# Altium project Fitness-Tracker-v1.0.PrjPcb
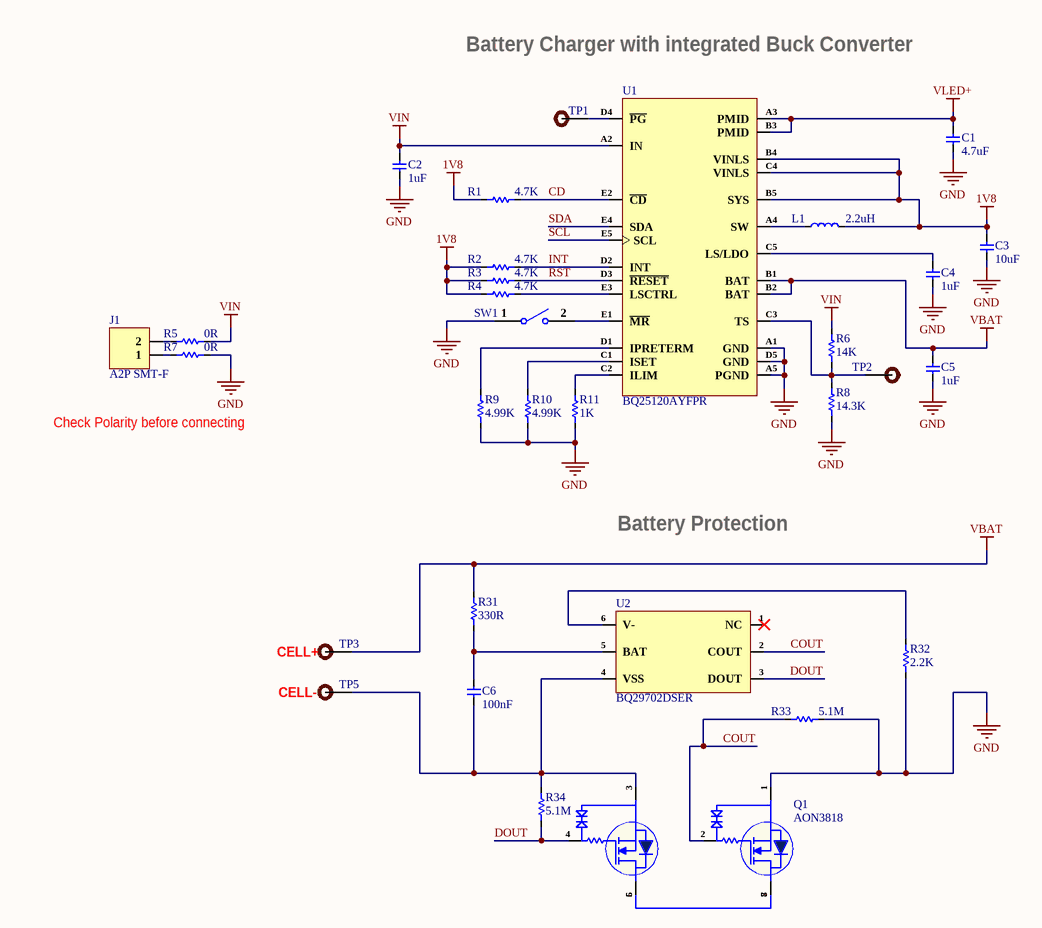
[diagram p0: Power-Sheet.SchDoc]
3 sheets, 65 parts. Net scope: global (net labels, ports and power ports of the same name join across sheets).
Board file: TrackerPCB-v1.0.PcbDoc
Sheets:
  Power-Sheet.SchDoc
  Controller-Sheet.SchDoc
  Sensors-Sheet.SchDoc

## Sheet Power-Sheet.SchDoc
size A4; SheetNumber: 1; SheetTotal: 3

### Parts
C1  4.7uF  [Cap-0402]
C2  1uF  [CAP-0201]
C3  10uF  [Cap-0402]
C4  1uF  [CAP-0201]
C5  1uF  [CAP-0201]
C6  100nF  [CAP-0201]
J1  A2P SMT-F  [A2P SMT-F]
L1  2.2uH  [IND-0805]
Q1  AON3818  [DFN-8(3x3)]
R1  4.7K  [Res-0201]
R2  4.7K  [Res-0201]
R3  4.7K  [Res-0201]
R4  4.7K  [Res-0201]
R5  0R  [Res-0201]
R6  14K  [Res-0201]
R7  0R  [Res-0201]
R8  14.3K  [Res-0201]
R9  4.99K  [Res-0402]
R10  4.99K  [Res-0402]
R11  1K  [Res-0201]
R31  330R  [Res-0201]
R32  2.2K  [Res-0201]
R33  5.1M  [Res-0201]
R34  5.1M  [Res-0201]
SW1  B3U-1000P  [B3U-1000P]  (value not drawn)
TP1  TEST POINT 0.5mm Dia  [Test-point - 0.5mm]  (value not drawn)  (no BOM)
TP2  TEST POINT 0.5mm Dia  [Test-point - 0.5mm]  (value not drawn)  (no BOM)
TP3  3x4mm Test Pad SMD  [3x4mm Test Pad SMD]  (value not drawn)
TP5  3x4mm Test Pad SMD  [3x4mm Test Pad SMD]  (value not drawn)
U1  BQ25120AYFPR  [25-DSBGA]
U2  BQ29702DSER  [WSON-6(1.5x1.5)]

### Nets
1V8: C3.2 L1.2 R1.1 R2.1 R3.1 R4.1 U1.B4(VINLS) U1.B5(SYS) U1.C4(VINLS)
GND: C1.1 C2.1 C3.1 C4.1 C5.1 Q1.1(S2) R7.2 R8.1 R9.1 R10.1 R11.1 R32.1 R33.1 SW1.1 U1.A1(GND) U1.A5(PGND) U1.D5(GND)
VBAT: C5.2 R31.2 TP3.1 U1.B1(BAT) U1.B2(BAT)
VIN: C2.2 R5.2 R6.2 U1.A2(IN)
VLED+: C1.2 U1.A3(PMID) U1.B3(PMID)
CD: R1.2 U1.E2(~{CD})
COUT: Q1.2(G2) R33.2 U2.2(COUT)
DOUT: Q1.4(G1) R34.1 U2.3(DOUT)
INT: R2.2 U1.D2(INT)
RST: R3.2 U1.D3(~{RESET})
SCL: U1.E5(SCL)
SDA: U1.E4(SDA)
NetC4_2: C4.2 U1.C5(LS/LDO)
NetC6_1: C6.1 R31.1 U2.5(BAT)
NetC6_2: C6.2 Q1.3(S1) R34.2 TP5.1 U2.4(VSS)
NetJ1_1: J1.1 R7.1
NetJ1_2: J1.2 R5.1
NetL1_1: L1.1 U1.A4(SW)
NetQ1_5: Q1.5(D2) Q1.6(D2)
NetQ1_7: Q1.7(D1) Q1.8(D1)
NetR4_2: R4.2 U1.E3(LSCTRL)
NetR6_1: R6.1 R8.2 TP2.1 U1.C3(TS)
NetR9_2: R9.2 U1.D1(IPRETERM)
NetR10_2: R10.2 U1.C1(ISET)
NetR11_2: R11.2 U1.C2(ILIM)
NetR32_2: R32.2 U2.6(V-)
NetSW1_2: SW1.2 U1.E1(~{MR})
NetTP1_1: TP1.1 U1.D4(~{PG})

Not connected (* = marked no-connect by the designer): U2 1(NC)*

### Notes on the sheet
- Battery Charger with integrated Buck Converter
- Check Polarity before connecting
- Battery Protection
- (near TP3) CELL+
- (near TP5) CELL-
- File:
- Title:
- Date:
- Page
- Num:
- Total:
- Drawn By: Huzaifa Ali

### Library data of the parts
C1 = CC0402KRX5R6BB475: CAP CER 4.7UF 10V X5R 0402; Manufacturer: Yageo; Tolerance: 10%; Supplier 1: Farnell; Manufacturer Part Number: CC0402KRX5R6BB475; RoHS: Yes; Category: Ceramic Capacitors; Stock 1: 20000; Pricing 1: 10000=0.02310, 50000=0.02100 (GBP); Mount: Surface Mount; Case/Package: 0402; Case Code (Imperial): 0402; Case Code (Metric): 1005; Min Operating Temperature: -55°C; Max Operating Temperature: 85°C; Packaging: Cut Tape; Capacitance: 4.7uF; Voltage Rating: 10V; RoHS Compliant: Yes; ComponentLink1URL: http://www.yageo.com/documents/recent/UPY-GPHC_X5R_4V-to-50V_25.pdf?src-supplier=Digi-Key; ComponentLink1Description: http://www.yageo.com/documents/recent/UPY-GPHC_X5R_4V-to-50V_25.pdf?src-supplier=Digi-Key; Supplier Part Number 1: 3871698; LCSC Part Number: C326586
C2 C4 C5 = CC0201MRX5R6BB105: CAP CER 1UF 10V X5R 0201; Manufacturer: Yageo; Item Type: Capacitor; Supplier: Digi-Key; Supplier Part Number: 311-3474-1-ND; Manufacturer Part Number: CC0201MRX5R6BB105; RoHS: Yes; Category: Ceramic Capacitors; Stock: 772400; Pricing: 1=0.19, 10=0.135, 50=0.0764, 100=0.0633, 500=0.04436, 1000=0.03672, 2500=0.03418, 5000=0.03127 (USD); ComponentLink1URL: https://datasheet.octopart.com/CC0201MRX5R6BB105-Yageo-datasheet-158238148.pdf?src-supplier=Farnell; ComponentLink1Description: https://datasheet.octopart.com/CC0201MRX5R6BB105-Yageo-datasheet-158238148.pdf?src-supplier=Farnell; ComponentLink2URL: http://www.yageo.com/documents/recent/UPY-GPHC_X5R_4V-to-50V_25.pdf?src-supplier=Digi-Key; ComponentLink2Description: http://www.yageo.com/documents/recent/UPY-GPHC_X5R_4V-to-50V_25.pdf?src-supplier=Digi-Key; ComponentLink3URL: https://datasheet.octopart.com/CC0201MRX5R6BB105-Yageo-datasheet-137700082.pdf?src-supplier=Future+Electronics; ComponentLink3Description: https://datasheet.octopart.com/CC0201MRX5R6BB105-Yageo-datasheet-137700082.pdf?src-supplier=Future+Electronics; LCSC Part Number: C605210
C3 = CC0402MRX5R6BB106: CAP CER 10UF 10V X5R 0402; Manufacturer: Yageo; Tolerance: 20%; Item Type: Capacitor; Supplier 1: Future Electronics; Manufacturer Part Number: CC0402MRX5R6BB106; RoHS: Yes; Category: Ceramic Capacitors; Stock 1: 80000; Pricing 1: 10000=0.02650, 20000=0.02590, 30000=0.02550, 40000=0.02530, 50000=0.02450 (USD); Mount: Surface Mount; Case/Package: 0402; Case Code (Imperial): 0402; Case Code (Metric): 1005; Min Operating Temperature: -55°C; Max Operating Temperature: 85°C; Packaging: Tape and Reel; Capacitance: 10uF; Voltage Rating: 10V; RoHS Compliant: Yes; ComponentLink1URL: http://www.yageo.com/documents/recent/UPY-GPHC_X5R_4V-to-50V_25.pdf?src-supplier=Digi-Key; ComponentLink1Description: http://www.yageo.com/documents/recent/UPY-GPHC_X5R_4V-to-50V_25.pdf?src-supplier=Digi-Key; Supplier Part Number 1: 6097631; LCSC Part Number: C962143
C6 = CC0201KRX5R6BB104: CAP CER 0.1UF 10V X5R 0201; Manufacturer: Yageo; Tolerance: 10%; Supplier 1: Mouser; Manufacturer Part Number: CC0201KRX5R6BB104; RoHS: Yes; Category: Ceramic Capacitors; Stock 1: 824403; Pricing 1: 1=0.10000, 10=0.02400, 50=0.02400, 100=0.01900, 1000=0.01100, 10000=0.00900 (USD); Mount: Surface Mount; Case/Package: 0201; Case Code (Imperial): 0201; Case Code (Metric): 0603; Weight: 6E-06oz; Min Operating Temperature: -55°C; Max Operating Temperature: 85°C; Capacitance: 100nF; Dielectric: X5R; Voltage Rating (DC): 10V; Packaging: Tape and Reel; Termination: SMD/SMT; Resistor Type: Ceramic; Voltage Rating: 10V; Series: CC; Construction: Flat; Length: 0.6mm; Width: 0.012inch; Height: 0.3mm; Thickness: 0.013inch; Depth: 0.3mm; Radiation Hardening: No; Lead Free: Lead Free; Halogen Free: Halogen Free; RoHS Compliant: Yes; ComponentLink1URL: https://datasheet.ciiva.com/11587/upy-gphc-x5r-4v-to-50v-12-11587190.pdf?src-supplier=Avnet; ComponentLink1Description: https://datasheet.ciiva.com/11587/upy-gphc-x5r-4v-to-50v-12-11587190.pdf?src-supplier=Avnet; Supplier Part Number 1: 603-CC201KRX5R6BB104; LCSC Part Number: C190183
J1 = A2P SMT-F: Magnetic Pogo Pin Connector 2 Positions Pitch 2.5/2.6 MM Spring Loaded Female Strip; Manufacturer Part Number: Pogo Pin Connector 2 Pin Female (2mm Height); ComponentLink1Description: Aliexpress; ComponentLink1URL: https://vi.aliexpress.com/item/1005003511237426.html#nav-description
L1 = LQM21PN2R2MGHL: FIXED IND 2.2UH 1.3A 156MOHM SMD; Manufacturer: Murata; Item Type: Fixed Inductors; Core Material: Ferrite; Saturation Current: 450mA; Shielding: Shielded; DC Resistance (DCR): 156mR; Self Resonant Frequency: 40MHz; Test Frequency: 1MHz; Tolerance: 20%; RMS Current (Irms): 1.7A; Supplier: Mouser; LCSC Part Number: C341781; Manufacturer Part Number: LQM21PN2R2MGHL; RoHS: Yes; Stock: 122655; Pricing: 1=0.3, 10=0.246, 50=0.246, 100=0.203, 1000=0.167, 10000=0.129 (USD); Mounting Technology: Surface Mount; Case/Package: 0805; Case Code (Metric): 2012; Case Code (Imperial): 0805; Min Operating Temperature: -40°C; Max Operating Temperature: 85°C; Packaging: Cut Tape; Value: 2.2uH; Current Rating: 1.3A; Series: LQM21PN_GH; ESR: 156mR; Length: 0.079inch; Width: 0.049inch; Height - Seated (Max): 0.039inch; RoHS Compliant: Yes; ComponentLink1URL: http://search.murata.co.jp/Ceramy/image/img/P02/JELF243B-0040.pdf?src-supplier=Digikey; ComponentLink1Description: http://search.murata.co.jp/Ceramy/image/img/P02/JELF243B-0040.pdf?src-supplier=Digikey; ComponentLink2URL: http://www.murata.com/~/media/webrenewal/support/library/catalog/products/inductor/chip/o05e.ashx?src-supplier=Digikey; ComponentLink2Description: http://www.murata.com/~/media/webrenewal/support/library/catalog/products/inductor/chip/o05e.ashx?src-supplier=Digikey
Q1 = AON3818: 24V 8A 21mΩ@2.5V 2.7W 1.2V@250uA 2 N-Channel DFN-8(3x3) MOSFETs ROHS; Manufacturer: AOS; Item Type: Mosfet; Manufacturer Part Number: AON3818; Package: DFN-8(3x3); LCSC Part Number: C357850
R1-R4 = RC0201FR-074K7L: RES 4.7K OHM 1% 1/20W 0201; Manufacturer: Yageo; Item Type: Resistor; Supplier: Future Electronics; Supplier Part Number: 7537285; Manufacturer Part Number: RC0201FR-074K7L; RoHS: Yes; Category: Chip SMD Resistors; Stock: 1610000; Pricing: 10000=0.0014, 50000=0.0013, 250000=0.0013, 750000=0.0012, 2000000=0.0011 (USD); ComponentLink1URL: https://datasheet.ciiva.com/2493/pyu-r-int-thick-7-2493811.pdf?src-supplier=Digi-Key; ComponentLink1Description: https://datasheet.ciiva.com/2493/pyu-r-int-thick-7-2493811.pdf?src-supplier=Digi-Key; ComponentLink2URL: https://datasheet.ciiva.com/2493/pyu-r-int-thick-7-2493812.pdf?src-supplier=Digi-Key; ComponentLink2Description: https://datasheet.ciiva.com/2493/pyu-r-int-thick-7-2493812.pdf?src-supplier=Digi-Key; ComponentLink3URL: https://datasheet.ciiva.com/2493/pyu-r-int-thick-7-2493813.pdf?src-supplier=Digi-Key; ComponentLink3Description: https://datasheet.ciiva.com/2493/pyu-r-int-thick-7-2493813.pdf?src-supplier=Digi-Key; ComponentLink4URL: https://datasheet.ciiva.com/8892/pyu-rc0201-51-rohs-l-8-8892942.pdf?src-supplier=Avnet; ComponentLink4Description: https://datasheet.ciiva.com/8892/pyu-rc0201-51-rohs-l-8-8892942.pdf?src-supplier=Avnet; ComponentLink5URL: https://datasheet.ciiva.com/7672/1563626-7672233.pdf?src-supplier=Element14; ComponentLink5Description: https://datasheet.ciiva.com/7672/1563626-7672233.pdf?src-supplier=Element14; LCSC Part Number: C138135
R5 R7 = RC0201JR-070RL: RES SMD 0 OHM JUMPER 1/20W 0201; Manufacturer: Yageo; Power Rating: 50mW; Tolerance: 5%; Voltage Rating: 25V; Supplier 1: Digi-Key; Manufacturer Part Number: RC0201JR-070RL; RoHS: Yes; Category: Chip SMD Resistors; Stock 1: 11079; Pricing 1: 1=0.10000, 10=0.03600, 25=0.02640, 50=0.02000, 100=0.01480, 250=0.01128, 500=0.00904, 1000=0.00665, 5000=0.00477 (USD); Case/Package: 0201; Contact Plating: Tin,Matte; Case Code (Metric): 0603; Case Code (Imperial): 0201; Weight: 6E-06oz; Size Code: 0201; Min Operating Temperature: -55°C; Max Operating Temperature: 125°C; Resistor Type: Thick Film; Resistance: 0R; Packaging: Tape and Reel; Package Quantity: 10000; Number of Terminations: 2; Termination: SMD/SMT; Max Power Dissipation: 50mW; Voltage Rating (DC): 25V; Features: Moisture Resistant; Series: RC; Construction: Rectangular; Resistance Tolerance: 5%; Length: 0.6mm; Width: 0.012inch; Height: 0.01inch; Depth: 0.3mm; Radiation Hardening: No; RoHS Compliant: Yes; REACH SVHC: Unknown; Military Standard: Not; Lead Free: Lead Free; ComponentLink1URL: https://datasheet.ciiva.com/7672/1563626-7672247.pdf?src-supplier=Element14; ComponentLink1Description: https://datasheet.ciiva.com/7672/1563626-7672247.pdf?src-supplier=Element14; ComponentLink2URL: https://datasheet.ciiva.com/7660/1421516-7660808.pdf?src-supplier=Element14; ComponentLink2Description: https://datasheet.ciiva.com/7660/1421516-7660808.pdf?src-supplier=Element14; ComponentLink3URL: https://datasheet.ciiva.com/7672/1563626-7672248.pdf?src-supplier=Element14; ComponentLink3Description: https://datasheet.ciiva.com/7672/1563626-7672248.pdf?src-supplier=Element14; ComponentLink4URL: https://datasheet.ciiva.com/16855/pyu-rc0201-51-rohs-l-8-16855994.pdf?src-supplier=Avnet+Europe; ComponentLink4Description: https://datasheet.ciiva.com/16855/pyu-rc0201-51-rohs-l-8-16855994.pdf?src-supplier=Avnet+Europe; ComponentLink5URL: https://datasheet.ciiva.com/28419/pyu-rc0201-51-rohs-l-8-28419660.pdf?src-supplier=Avnet+Europe; ComponentLink5Description: https://datasheet.ciiva.com/28419/pyu-rc0201-51-rohs-l-8-28419660.pdf?src-supplier=Avnet+Europe; ComponentLink6URL: https://datasheet.ciiva.com/46391/1421516-46391340.pdf?src-supplier=Element14; ComponentLink6Description: https://datasheet.ciiva.com/46391/1421516-46391340.pdf?src-supplier=Element14; ComponentLink7URL: https://datasheet.ciiva.com/8896/pyu-rc0201-51-rohs-l-8-8896143.pdf?src-supplier=Avnet; ComponentLink7Description: https://datasheet.ciiva.com/8896/pyu-rc0201-51-rohs-l-8-8896143.pdf?src-supplier=Avnet; Supplier Part Number 1: 311-0.0NCT-ND; LCSC Part Number: C106228
R6 = 0201WMF1402TEE: 50mW Thick Film Resistor 25V ±1% ±200ppm/℃ 14kΩ 0201 Chip Resistor - Surface Mount ROHS; Manufacturer: UNI-ROYAL; Manufacturer Part Number: 0201WMF1402TEE; Package: 0201; LCSC Part Number: C474280; Item Type: Resistor; ComponentLink1Description: LCSC; ComponentLink1URL: https://www.lcsc.com/product-detail/C474280.html
R8 = RC0201FR-0714K3L: RES 14.3K OHM 1% 1/20W 0201; Manufacturer: Yageo; Item Type: Resistors; Voltage Rating: 25V; Supplier: Avnet; LCSC Part Number: C273298; Manufacturer Part Number: RC0201FR-0714K3L; RoHS: Yes; Stock: 7360; Pricing: 1=0.104, 25=0.018, 100=0.009, 250=0.008, 500=0.007 (USD); Lead Free: 5697LeadFree; ComponentLink1URL: https://www.yageo.com/upload/media/product/productsearch/datasheet/rchip/PYu-RC_Group_51_RoHS_L_11.pdf?src-supplier=Digikey; ComponentLink1Description: https://www.yageo.com/upload/media/product/productsearch/datasheet/rchip/PYu-RC_Group_51_RoHS_L_11.pdf?src-supplier=Digikey; ComponentLink2URL: http://www.yageo.com/documents/recent/PYu-RC_Group_51_RoHS_L_10.pdf?src-supplier=Digikey; ComponentLink2Description: http://www.yageo.com/documents/recent/PYu-RC_Group_51_RoHS_L_10.pdf?src-supplier=Digikey; ComponentLink3URL: http://www.yageo.com/documents/recent/PYu-RC_Group_51_RoHS_L_9.pdf?src-supplier=Digikey; ComponentLink3Description: http://www.yageo.com/documents/recent/PYu-RC_Group_51_RoHS_L_9.pdf?src-supplier=Digikey; ComponentLink4URL: https://datasheet.octopart.com/RC0201FR-0714K3L-Yageo-datasheet-164759695.pdf?src-supplier=Future+Electronics; ComponentLink4Description: https://datasheet.octopart.com/RC0201FR-0714K3L-Yageo-datasheet-164759695.pdf?src-supplier=Future+Electronics
R9 R10 = RC0402FR-074K99L: RES 4.99K OHM 1% 1/16W 0402; Manufacturer: Yageo; Item Type: Resistors; Value: 4.99kR; Power Rating: 62.5mW; Voltage Rating: 50V; Temperature Coefficient: 100ppm/°C; Max Power Dissipation: 63mW; Supplier: Mouser; LCSC Part Number: C137965; Manufacturer Part Number: RC0402FR-074K99L; RoHS: Yes; Stock: 181979; Pricing: 1=0.1, 10=0.007, 50=0.007, 100=0.004, 1000=0.004, 10000=0.002 (USD); Case/Package: 0402; Case Code (Imperial): 0402; Case Code (Metric): 1005; Min Operating Temperature: -55°C; Max Operating Temperature: 155°C; Tolerance: 1%; Package Quantity: 1; Packaging: Tape and Reel; Resistor Type: Thick Film; Termination: SMD/SMT; Number of Terminations: 2; Features: Moisture Resistant; Series: RC; Construction: Rectangular; Resistance Tolerance: 1%; Voltage Rating (DC): 50V; Length: 1mm; Width: 0.02inch; Height: 0.016inch; Depth: 0.5mm; Reach SVHC Compliant: No; Military Standard: Not; RoHS Compliant: Yes; Lead Free: 5697LeadFree; ComponentLink1URL: https://datasheet.ciiva.com/7983/1018594-7983547.pdf?src-supplier=Element14; ComponentLink1Description: https://datasheet.ciiva.com/7983/1018594-7983547.pdf?src-supplier=Element14; ComponentLink2URL: https://datasheet.ciiva.com/2553/pyu-r-int-thick-7-2553228.pdf?src-supplier=Digikey; ComponentLink2Description: https://datasheet.ciiva.com/2553/pyu-r-int-thick-7-2553228.pdf?src-supplier=Digikey; ComponentLink3URL: https://datasheet.ciiva.com/2553/pyu-r-int-thick-7-2553229.pdf?src-supplier=Digikey; ComponentLink3Description: https://datasheet.ciiva.com/2553/pyu-r-int-thick-7-2553229.pdf?src-supplier=Digikey; ComponentLink4URL: https://datasheet.ciiva.com/2553/pyu-r-int-thick-7-2553227.pdf?src-supplier=Digikey; ComponentLink4Description: https://datasheet.ciiva.com/2553/pyu-r-int-thick-7-2553227.pdf?src-supplier=Digikey; ComponentLink5URL: https://datasheet.ciiva.com/17040/pyu-rc0402-51-rohs-l-6-r-17040490.pdf?src-supplier=Future+Electronics; ComponentLink5Description: https://datasheet.ciiva.com/17040/pyu-rc0402-51-rohs-l-6-r-17040490.pdf?src-supplier=Future+Electronics; ComponentLink6URL: https://datasheet.ciiva.com/15159/getdatasheetpartid-33192-15159419.pdf?src-supplier=Verical; ComponentLink6Description: https://datasheet.ciiva.com/15159/getdatasheetpartid-33192-15159419.pdf?src-supplier=Verical
R11 = RC0201FR-071KP: RES 1K OHM 1% 1/20W 0201; Manufacturer: Yageo; Supplier 1: Digi-Key; Manufacturer Part Number: RC0201FR-071KP; RoHS: Yes; Stock 1: 4800; Pricing 1: 1=0.11000, 10=0.10200, 100=0.03940, 1000=0.01734, 2500=0.01497, 5000=0.01340 (USD); RoHS Compliant: Yes; Supplier Part Number 1: 13-RC0201FR-071KPCT-ND; LCSC Part Number: C3953443
R31 = RC0201FR-07330RL: 50mW Thick Film Resistor 25V ±1% ±200ppm/℃ 330Ω 0201 Chip Resistor - Surface Mount ROHS; Manufacturer: YAGEO; Manufacturer Part Number: RC0201FR-07330RL; Package: 0201; LCSC Part Number: C274872; Item Type: Resistor
R32 = RC0201FR-072K2L: RES 2.2K OHM 1% 1/20W 0201; Manufacturer: Yageo; Resistance: 2.2kR; Power Rating: 50mW; Voltage Rating: 25V; Temperature Coefficient: 200ppm/°C; Item Type: Resistor; Supplier 1: Arrow Electronics; Manufacturer Part Number: RC0201FR-072K2L; RoHS: Yes; Category: Chip SMD Resistors; Stock 1: 90000; Pricing 1: 10000=0.00510, 30000=0.00350, 50000=0.00330, 100000=0.00220 (USD); Case/Package: 0201; Case Code (Imperial): 0201; Case Code (Metric): 0603; Size Code: 0201; Min Operating Temperature: -55°C; Max Operating Temperature: 125°C; Tolerance: 1%; Packaging: Tape and Reel; Resistor Type: Thick Film; Number of Terminations: 2; Termination: SMD/SMT; Max Power Dissipation: 50mW; Features: Moisture Resistant; Series: RC; Resistance Tolerance: 1%; Construction: Rectangular; Length: 0.024inch; Width: 0.3mm; Height: 0.01inch; Depth: 0.3mm; Military Standard: Not; Lead Free: Lead Free; RoHS Compliant: Yes; ComponentLink1URL: https://datasheet.ciiva.com/7672/1563626-7672218.pdf?src-supplier=Element14; ComponentLink1Description: https://datasheet.ciiva.com/7672/1563626-7672218.pdf?src-supplier=Element14; Supplier Part Number 1: RC0201FR-072K2L; LCSC Part Number: C142018
R33 R34 = RC0201FR-075M1L: 50mW Thick Film Resistor 25V ±1% ±200ppm/℃ 5.1MΩ 0201 Chip Resistor - Surface Mount ROHS; Manufacturer: YAGEO; Manufacturer Part Number: RC0201FR-075M1L; Package: 0201; LCSC Part Number: C474428; Item Type: Resistor
SW1 = B3U-1000P: SWITCH TACTILE SPST-NO 0.05A 12V; Manufacturer: Omron; Mechanical Life: 200000Cycles; Operating Force: 1.5N; Throw Configuration: SPST; Current Rating: 50mA; Contact Resistance: 100mR; Illumination Type: Non-Illuminated,Illuminated; Switch Travel: 0.15mm; Switch Function: Off-Mom; Actuator Type: Standard; Actuator Length: 0.4mm; Ratings: Dust Proof,IP40; ComponentLink1URL: http://www.farnell.com/datasheets/60838.pdf?src-supplier=Farnell; ComponentLink1Description: http://www.farnell.com/datasheets/60838.pdf?src-supplier=Farnell; ComponentLink2URL: http://www.farnell.com/datasheets/60838.pdf?src-supplier=Element14; ComponentLink2Description: http://www.farnell.com/datasheets/60838.pdf?src-supplier=Element14; ComponentLink3URL: https://omronfs.omron.com/en_US/ecb/products/pdf/en-b3u.pdf?src-supplier=Digi-Key; ComponentLink3Description: https://omronfs.omron.com/en_US/ecb/products/pdf/en-b3u.pdf?src-supplier=Digi-Key; ComponentLink4URL: http://www.omron.com/ecb/products/pdf/en-b3u.pdf?src-supplier=Digi-Key; ComponentLink4Description: http://www.omron.com/ecb/products/pdf/en-b3u.pdf?src-supplier=Digi-Key; ComponentLink5URL: https://www.distrelec.biz/Web/Downloads/he/et/B3U_eng_datasheet.pdf?mime=application%2Fpdf&src-supplier=Distrelec; ComponentLink5Description: https://www.distrelec.biz/Web/Downloads/he/et/B3U_eng_datasheet.pdf?mime=application%2Fpdf&src-supplier=Distrelec; ComponentLink6URL: http://www.onlinecomponents.com/productFiles/mf-OM/en-b3u.pdf?src-supplier=Onlinecomponents.com; ComponentLink6Description: http://www.onlinecomponents.com/productFiles/mf-OM/en-b3u.pdf?src-supplier=Onlinecomponents.com; Supplier 1: Digi-Key; Manufacturer Part Number: B3U-1000P; Stock 1: 116454; Pricing 1: 1=1, 10=0.961, 25=0.9064, 50=0.7976, 100=0.7251, 250=0.68888, 500=0.67074, 1000=0.52571 (USD); Mount: Surface Mount; Weight: 0.000776oz; Contact Material: Silver; Min Operating Temperature: -25°C; Max Operating Temperature: 70°C; Packaging: Tape and Reel; Voltage Rating (DC): 12V; Package Quantity: 1; Max Current Rating: 50mA; Termination: SMD/SMT; Orientation: Straight; Max Voltage Rating (DC): 12V; Electrical Life: 200000Cycles; Insulation Resistance: 100MR; Contact Current Rating: 50mA; Length: 4mm; Height: 1.2mm; Depth: 2.5mm; Width: 3mm; REACH SVHC: Unknown; Lead Free: Lead Free; ComponentLink7URL: https://www.verical.com/server-webapp/html/getDatasheet?partID=552554&src-supplier=Verical; ComponentLink7Description: https://www.verical.com/server-webapp/html/getDatasheet?partID=552554&src-supplier=Verical; ComponentLink8URL: http://www.farnell.com/datasheets/1685550.pdf?src-supplier=Element14; ComponentLink8Description: http://www.farnell.com/datasheets/1685550.pdf?src-supplier=Element14; ComponentLink9URL: http://www.farnell.com/datasheets/2610940.pdf?src-supplier=Farnell; ComponentLink9Description: http://www.farnell.com/datasheets/2610940.pdf?src-supplier=Farnell; ComponentLink10URL: https://www.alliedelec.com/m/d/4c8a9ef82804fc3c241a13c1e298fd73.pdf?src-supplier=Allied+Electronics; ComponentLink10Description: https://www.alliedelec.com/m/d/4c8a9ef82804fc3c241a13c1e298fd73.pdf?src-supplier=Allied+Electronics; Supplier Part Number 1: SW1020DKR-ND; LCSC Part Number: C231329; Item Type: Switch
TP1 TP2 = TEST POINT 0.5mm Dia: Test Point ON; Item Type: Test Point; Manufacturer Part Number: TEST POINT 0.5mm Dia
U1 = BQ25120AYFPR: IC BATT CHG LI-ION 1CELL 25DSBGA; Manufacturer: Texas Instruments; Min Supply Voltage: 3.4V; Nominal Supply Current: 1mA; Number of Outputs: 1NUMBER; Supplier: Mouser; LCSC Part Number: C2866577; Manufacturer Part Number: BQ25120AYFPR; RoHS: Yes; Item Type: IC; Stock: 1796; Pricing: 1=3.71, 10=2.8, 50=2.58, 100=2.33, 1000=1.97, 10000=1.83 (USD); Pins: 25NUMBER; Width: 0m; Height: 500um; Thickness: 0m; ComponentLink1URL: http://www.ti.com/lit/ds/symlink/bq25120a.pdf?src-supplier=Digikey; ComponentLink1Description: http://www.ti.com/lit/ds/symlink/bq25120a.pdf?src-supplier=Digikey
U2 = BQ29702DSER: 1.5V~8V Lithium Battery 1 WSON-6(1.5x1.5) Battery Management ROHS; Manufacturer: TI; Item Type: IC; Manufacturer Part Number: BQ29702DSER; Package: WSON-6(1.5x1.5); LCSC Part Number: C2872632

## Sheet Controller-Sheet.SchDoc
size A4; SheetNumber: 2; SheetTotal: 3
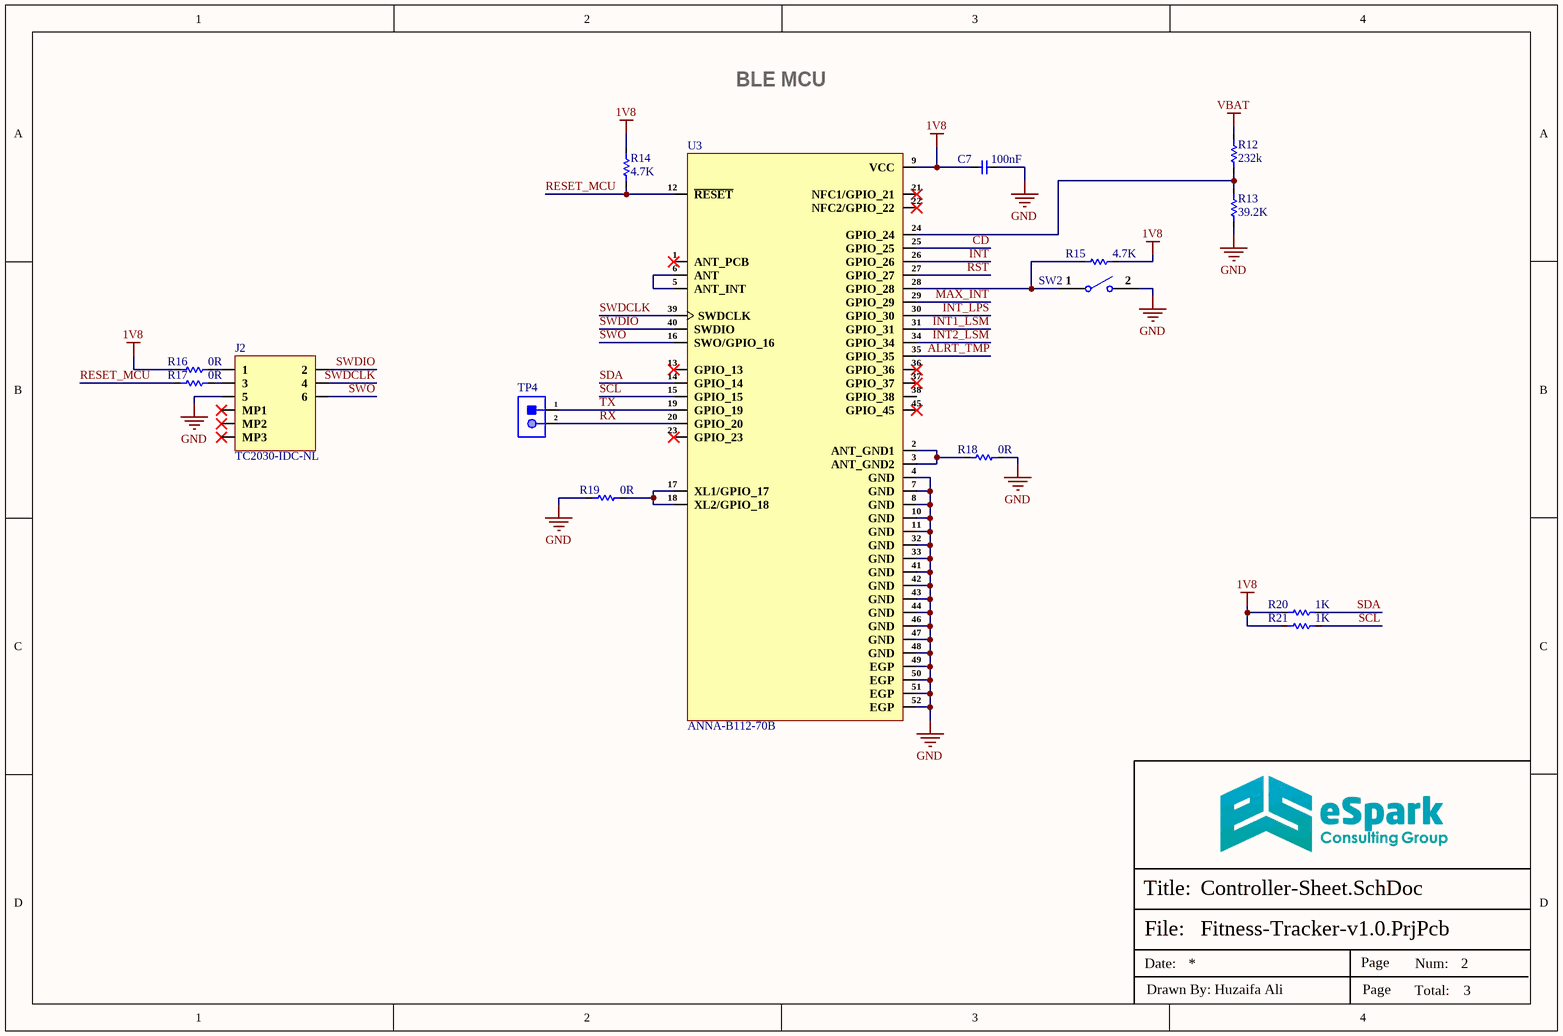
[diagram p1: Controller-Sheet.SchDoc]

### Parts
C7  100nF  [CAP-0201]
J2  TC2030-IDC-NL  [TC2030-IDC-NL_]
R12  232k  [Res-0402]
R13  39.2K  [Res-0402]
R14  4.7K  [Res-0201]
R15  4.7K  [Res-0201]
R16  0R  [Res-0201]
R17  0R  [Res-0201]
R18  0R  [Res-0201]
R19  0R  [Res-0201]
R20  1K  [Res-0201]
R21  1K  [Res-0201]
SW2  B3U-1000P  [B3U-1000P]  (value not drawn)
TP4  2 Test Pad  [2 Test Pad]  (value not drawn)  (no BOM)
U3  ANNA-B112-70B  [ANNA-B112-70B]

### Nets
1V8: C7.2 R14.2 R15.1 R16.1 R20.2 R21.2 U3.9(VCC)
GND: C7.1 J2.5 R13.1 R18.2 R19.1 SW2.2 U3.4(GND) U3.7(GND) U3.8(GND) U3.10(GND) U3.11(GND) U3.32(GND) U3.33(GND) U3.41(GND) U3.42(GND) U3.43(GND) U3.44(GND) U3.46(GND) U3.47(GND) U3.48(GND) U3.49(EGP) U3.50(EGP) U3.51(EGP) U3.52(EGP)
VBAT: R12.2
ALRT_TMP: U3.35(GPIO_35)
CD: U3.25(GPIO_25)
INT: U3.26(GPIO_26)
INT1_LSM: U3.31(GPIO_31)
INT2_LSM: U3.34(GPIO_34)
INT_LPS: U3.30(GPIO_30)
MAX_INT: U3.29(GPIO_29)
RESET_MCU: R14.1 R17.1 U3.12(~{RESET})
RST: U3.27(GPIO_27)
RX: TP4.2 U3.20(GPIO_20)
SCL: R21.1 U3.15(GPIO_15)
SDA: R20.1 U3.14(GPIO_14)
SWDCLK: J2.4 U3.39(SWDCLK)
SWDIO: J2.2 U3.40(SWDIO)
SWO: J2.6 U3.16(SWO/GPIO_16)
TX: TP4.1 U3.19(GPIO_19)
NetJ2_1: J2.1 R16.2
NetJ2_3: J2.3 R17.2
NetR12_1: R12.1 R13.2 U3.24(GPIO_24)
NetR15_2: R15.2 SW2.1 U3.28(GPIO_28)
NetR18_1: R18.1 U3.2(ANT_GND1) U3.3(ANT_GND2)
NetR19_2: R19.2 U3.17(XL1/GPIO_17) U3.18(XL2/GPIO_18)
NetU3_5: U3.5(ANT_INT) U3.6(ANT)

Not connected (* = marked no-connect by the designer): J2 MP1* MP2* MP3*; U3 1(ANT_PCB)* 13(GPIO_13)* 21(NFC1/GPIO_21)* 22(NFC2/GPIO_22)* 23(GPIO_23)* 36(GPIO_36)* 37(GPIO_37)* 38(GPIO_38) 45(GPIO_45)*

### Notes on the sheet
- BLE MCU
- File:
- Title:
- Date:
- Page
- Num:
- Total:
- Drawn By: Huzaifa Ali

### Library data of the parts
C7 = CC0201KRX5R6BB104: as C6 on sheet Power-Sheet; Supplier 1: Mouser; Manufacturer Part Number: CC0201KRX5R6BB104; RoHS: Yes; Category: Ceramic Capacitors; Stock 1: 824403; Pricing 1: 1=0.10000, 10=0.02400, 50=0.02400, 100=0.01900, 1000=0.01100, 10000=0.00900 (USD); Mount: Surface Mount; Case/Package: 0201; Case Code (Imperial): 0201; Case Code (Metric): 0603; Weight: 6E-06oz; Min Operating Temperature: -55°C; Max Operating Temperature: 85°C; Capacitance: 100nF; Dielectric: X5R; Voltage Rating (DC): 10V; Packaging: Tape and Reel; Termination: SMD/SMT; Resistor Type: Ceramic; Voltage Rating: 10V; Series: CC; Construction: Flat; Length: 0.6mm; Width: 0.012inch; Height: 0.3mm; Thickness: 0.013inch; Depth: 0.3mm; Radiation Hardening: No; Lead Free: Lead Free; Halogen Free: Halogen Free; RoHS Compliant: Yes; ComponentLink1URL: https://datasheet.ciiva.com/11587/upy-gphc-x5r-4v-to-50v-12-11587190.pdf?src-supplier=Avnet; ComponentLink1Description: https://datasheet.ciiva.com/11587/upy-gphc-x5r-4v-to-50v-12-11587190.pdf?src-supplier=Avnet; Supplier Part Number 1: 603-CC201KRX5R6BB104; LCSC Part Number: C190183
R12 = RT0402BRD07232KL: RES 232K OHM 0.1% 1/16W 0402; Manufacturer: Yageo; Item Type: Resistor; Supplier: Mouser; Supplier Part Number: 603-RT0402BRD07232KL; Manufacturer Part Number: RT0402BRD07232KL; RoHS: Yes; Category: Chip SMD Resistors; Stock: 9850; Pricing: 1=0.47, 10=0.338, 50=0.338, 100=0.135, 1000=0.067, 10000=0.048 (USD); ComponentLink1URL: https://datasheet.octopart.com/RT0402BRD07232KL-Yageo-datasheet-166250672.pdf?src-supplier=Future+Electronics; ComponentLink1Description: https://datasheet.octopart.com/RT0402BRD07232KL-Yageo-datasheet-166250672.pdf?src-supplier=Future+Electronics; LCSC Part Number: C852652
R13 = RT0402BRD0739K2L: RES SMD 39.2KOHM 0.1% 1/16W 0402; Manufacturer: Yageo; Item Type: Resistors; Supplier: Digikey; LCSC Part Number: C723512; Manufacturer Part Number: RT0402BRD0739K2L; RoHS: Yes; Stock: 17375; Pricing: 1=0.16, 10=0.124, 50=0.1, 100=0.0898, 500=0.06834, 1000=0.06018, 5000=0.04449 (USD); ComponentLink1URL: https://datasheet.ciiva.com/12721/pyu-rt-1-to-0-05-rohs-l-4-12721702.pdf?src-supplier=Mouser; ComponentLink1Description: https://datasheet.ciiva.com/12721/pyu-rt-1-to-0-05-rohs-l-4-12721702.pdf?src-supplier=Mouser
R14 R15 = RC0201FR-074K7L: as R1 on sheet Power-Sheet; Supplier: Future Electronics; Supplier Part Number: 7537285; Manufacturer Part Number: RC0201FR-074K7L; RoHS: Yes; Category: Chip SMD Resistors; Stock: 1610000; Pricing: 10000=0.0014, 50000=0.0013, 250000=0.0013, 750000=0.0012, 2000000=0.0011 (USD); ComponentLink1URL: https://datasheet.ciiva.com/2493/pyu-r-int-thick-7-2493811.pdf?src-supplier=Digi-Key; ComponentLink1Description: https://datasheet.ciiva.com/2493/pyu-r-int-thick-7-2493811.pdf?src-supplier=Digi-Key; ComponentLink2URL: https://datasheet.ciiva.com/2493/pyu-r-int-thick-7-2493812.pdf?src-supplier=Digi-Key; ComponentLink2Description: https://datasheet.ciiva.com/2493/pyu-r-int-thick-7-2493812.pdf?src-supplier=Digi-Key; ComponentLink3URL: https://datasheet.ciiva.com/2493/pyu-r-int-thick-7-2493813.pdf?src-supplier=Digi-Key; ComponentLink3Description: https://datasheet.ciiva.com/2493/pyu-r-int-thick-7-2493813.pdf?src-supplier=Digi-Key; ComponentLink4URL: https://datasheet.ciiva.com/8892/pyu-rc0201-51-rohs-l-8-8892942.pdf?src-supplier=Avnet; ComponentLink4Description: https://datasheet.ciiva.com/8892/pyu-rc0201-51-rohs-l-8-8892942.pdf?src-supplier=Avnet; ComponentLink5URL: https://datasheet.ciiva.com/7672/1563626-7672233.pdf?src-supplier=Element14; ComponentLink5Description: https://datasheet.ciiva.com/7672/1563626-7672233.pdf?src-supplier=Element14; LCSC Part Number: C138135
R16-R19 = RC0201JR-070RL: as R5 on sheet Power-Sheet; Supplier 1: Digi-Key; Manufacturer Part Number: RC0201JR-070RL; RoHS: Yes; Category: Chip SMD Resistors; Stock 1: 11079; Pricing 1: 1=0.10000, 10=0.03600, 25=0.02640, 50=0.02000, 100=0.01480, 250=0.01128, 500=0.00904, 1000=0.00665, 5000=0.00477 (USD); Case/Package: 0201; Contact Plating: Tin,Matte; Case Code (Metric): 0603; Case Code (Imperial): 0201; Weight: 6E-06oz; Size Code: 0201; Min Operating Temperature: -55°C; Max Operating Temperature: 125°C; Resistor Type: Thick Film; Resistance: 0R; Packaging: Tape and Reel; Package Quantity: 10000; Number of Terminations: 2; Termination: SMD/SMT; Max Power Dissipation: 50mW; Voltage Rating (DC): 25V; Features: Moisture Resistant; Series: RC; Construction: Rectangular; Resistance Tolerance: 5%; Length: 0.6mm; Width: 0.012inch; Height: 0.01inch; Depth: 0.3mm; Radiation Hardening: No; RoHS Compliant: Yes; REACH SVHC: Unknown; Military Standard: Not; Lead Free: Lead Free; ComponentLink1URL: https://datasheet.ciiva.com/7672/1563626-7672247.pdf?src-supplier=Element14; ComponentLink1Description: https://datasheet.ciiva.com/7672/1563626-7672247.pdf?src-supplier=Element14; ComponentLink2URL: https://datasheet.ciiva.com/7660/1421516-7660808.pdf?src-supplier=Element14; ComponentLink2Description: https://datasheet.ciiva.com/7660/1421516-7660808.pdf?src-supplier=Element14; ComponentLink3URL: https://datasheet.ciiva.com/7672/1563626-7672248.pdf?src-supplier=Element14; ComponentLink3Description: https://datasheet.ciiva.com/7672/1563626-7672248.pdf?src-supplier=Element14; ComponentLink4URL: https://datasheet.ciiva.com/16855/pyu-rc0201-51-rohs-l-8-16855994.pdf?src-supplier=Avnet+Europe; ComponentLink4Description: https://datasheet.ciiva.com/16855/pyu-rc0201-51-rohs-l-8-16855994.pdf?src-supplier=Avnet+Europe; ComponentLink5URL: https://datasheet.ciiva.com/28419/pyu-rc0201-51-rohs-l-8-28419660.pdf?src-supplier=Avnet+Europe; ComponentLink5Description: https://datasheet.ciiva.com/28419/pyu-rc0201-51-rohs-l-8-28419660.pdf?src-supplier=Avnet+Europe; ComponentLink6URL: https://datasheet.ciiva.com/46391/1421516-46391340.pdf?src-supplier=Element14; ComponentLink6Description: https://datasheet.ciiva.com/46391/1421516-46391340.pdf?src-supplier=Element14; ComponentLink7URL: https://datasheet.ciiva.com/8896/pyu-rc0201-51-rohs-l-8-8896143.pdf?src-supplier=Avnet; ComponentLink7Description: https://datasheet.ciiva.com/8896/pyu-rc0201-51-rohs-l-8-8896143.pdf?src-supplier=Avnet; Supplier Part Number 1: 311-0.0NCT-ND; LCSC Part Number: C106228
R20 R21 = RC0201FR-071KP: as R11 on sheet Power-Sheet; Supplier 1: Digi-Key; Manufacturer Part Number: RC0201FR-071KP; RoHS: Yes; Stock 1: 4800; Pricing 1: 1=0.11000, 10=0.10200, 100=0.03940, 1000=0.01734, 2500=0.01497, 5000=0.01340 (USD); RoHS Compliant: Yes; Supplier Part Number 1: 13-RC0201FR-071KPCT-ND; LCSC Part Number: C3953443
SW2 = B3U-1000P: as SW1 on sheet Power-Sheet; ComponentLink1URL: http://www.farnell.com/datasheets/60838.pdf?src-supplier=Farnell; ComponentLink1Description: http://www.farnell.com/datasheets/60838.pdf?src-supplier=Farnell; ComponentLink2URL: http://www.farnell.com/datasheets/60838.pdf?src-supplier=Element14; ComponentLink2Description: http://www.farnell.com/datasheets/60838.pdf?src-supplier=Element14; ComponentLink3URL: https://omronfs.omron.com/en_US/ecb/products/pdf/en-b3u.pdf?src-supplier=Digi-Key; ComponentLink3Description: https://omronfs.omron.com/en_US/ecb/products/pdf/en-b3u.pdf?src-supplier=Digi-Key; ComponentLink4URL: http://www.omron.com/ecb/products/pdf/en-b3u.pdf?src-supplier=Digi-Key; ComponentLink4Description: http://www.omron.com/ecb/products/pdf/en-b3u.pdf?src-supplier=Digi-Key; ComponentLink5URL: https://www.distrelec.biz/Web/Downloads/he/et/B3U_eng_datasheet.pdf?mime=application%2Fpdf&src-supplier=Distrelec; ComponentLink5Description: https://www.distrelec.biz/Web/Downloads/he/et/B3U_eng_datasheet.pdf?mime=application%2Fpdf&src-supplier=Distrelec; ComponentLink6URL: http://www.onlinecomponents.com/productFiles/mf-OM/en-b3u.pdf?src-supplier=Onlinecomponents.com; ComponentLink6Description: http://www.onlinecomponents.com/productFiles/mf-OM/en-b3u.pdf?src-supplier=Onlinecomponents.com; Supplier 1: Digi-Key; Manufacturer Part Number: B3U-1000P; Stock 1: 116454; Pricing 1: 1=1, 10=0.961, 25=0.9064, 50=0.7976, 100=0.7251, 250=0.68888, 500=0.67074, 1000=0.52571 (USD); Mount: Surface Mount; Weight: 0.000776oz; Contact Material: Silver; Min Operating Temperature: -25°C; Max Operating Temperature: 70°C; Packaging: Tape and Reel; Voltage Rating (DC): 12V; Package Quantity: 1; Max Current Rating: 50mA; Termination: SMD/SMT; Orientation: Straight; Max Voltage Rating (DC): 12V; Electrical Life: 200000Cycles; Insulation Resistance: 100MR; Contact Current Rating: 50mA; Length: 4mm; Height: 1.2mm; Depth: 2.5mm; Width: 3mm; REACH SVHC: Unknown; Lead Free: Lead Free; ComponentLink7URL: https://www.verical.com/server-webapp/html/getDatasheet?partID=552554&src-supplier=Verical; ComponentLink7Description: https://www.verical.com/server-webapp/html/getDatasheet?partID=552554&src-supplier=Verical; ComponentLink8URL: http://www.farnell.com/datasheets/1685550.pdf?src-supplier=Element14; ComponentLink8Description: http://www.farnell.com/datasheets/1685550.pdf?src-supplier=Element14; ComponentLink9URL: http://www.farnell.com/datasheets/2610940.pdf?src-supplier=Farnell; ComponentLink9Description: http://www.farnell.com/datasheets/2610940.pdf?src-supplier=Farnell; ComponentLink10URL: https://www.alliedelec.com/m/d/4c8a9ef82804fc3c241a13c1e298fd73.pdf?src-supplier=Allied+Electronics; ComponentLink10Description: https://www.alliedelec.com/m/d/4c8a9ef82804fc3c241a13c1e298fd73.pdf?src-supplier=Allied+Electronics; Supplier Part Number 1: SW1020DKR-ND; LCSC Part Number: C231329; Item Type: Switch
TP4 = 2 Test Pad: Wire Connecting Pad; Item Type: Test Point; Manufacturer Part Number: 2 Test Pad
U3 = ANNA-B112-70B: RF TXRX MOD BLUETOOTH CHIP SMD; Manufacturer: u-blox; Item Type: Module; Supplier: Mouser; LCSC Part Number: C5451782; Manufacturer Part Number: ANNA-B112-70B; RoHS: No; Stock: 1511; Pricing: 1=7.09, 10=7.09, 50=7.09, 100=7.09, 1000=7.09, 10000=7.09 (USD)

## Sheet Sensors-Sheet.SchDoc
size A4; SheetNumber: 3; SheetTotal: 3
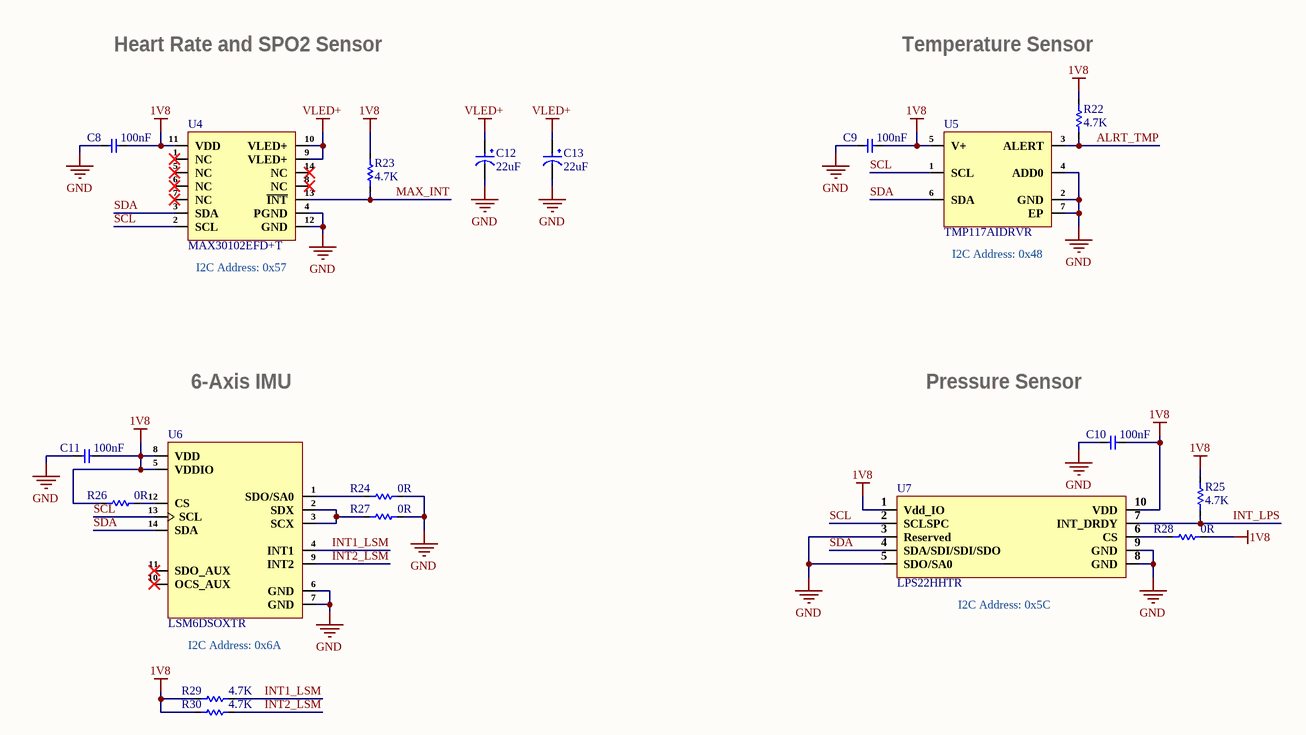
[diagram p2: Sensors-Sheet.SchDoc]

### Parts
C8  100nF  [CAP-0201]
C9  100nF  [CAP-0201]
C10  100nF  [CAP-0201]
C11  100nF  [CAP-0201]
C12  22uF  [Tant-0603]
C13  22uF  [Tant-0603]
R22  4.7K  [Res-0201]
R23  4.7K  [Res-0201]
R24  0R  [Res-0201]
R25  4.7K  [Res-0201]
R26  0R  [Res-0201]
R27  0R  [Res-0201]
R28  0R  [Res-0201]
R29  4.7K  [Res-0201]
R30  4.7K  [Res-0201]
U4  MAX30102EFD+T  [MAX30102EFD+T]
U5  TMP117AIDRVR  [WDFN-6-EP(2x2)]
U6  LSM6DSOXTR  [14-LGA (2.5x3)]
U7  LPS22HHTR  [HLGA-10(2x2)]

### Nets
1V8: C8.1 C9.1 C10.1 C11.1 R22.2 R23.2 R25.2 R26.1 R28.2 R29.2 R30.2 U4.11(VDD) U5.5(V+) U6.5(VDDIO) U6.8(VDD) U7.1(Vdd_IO) U7.10(VDD)
GND: C8.2 C9.2 C10.2 C11.2 C12.2 C13.2 R24.2 R27.2 U4.4(PGND) U4.12(GND) U5.2(GND) U5.4(ADD0) U5.7(EP) U6.6(GND) U6.7(GND) U7.3(Reserved) U7.5(SDO/SA0) U7.8(GND) U7.9(GND)
VLED+: C12.1 C13.1 U4.9(VLED+) U4.10(VLED+)
ALRT_TMP: R22.1 U5.3(ALERT)
INT1_LSM: R29.1 U6.4(INT1)
INT2_LSM: R30.1 U6.9(INT2)
INT_LPS: R25.1 U7.7(INT_DRDY)
MAX_INT: R23.1 U4.13(~{INT})
SCL: U4.2(SCL) U5.1(SCL) U6.13(SCL) U7.2(SCLSPC)
SDA: U4.3(SDA) U5.6(SDA) U6.14(SDA) U7.4(SDA/SDI/SDI/SDO)
NetR24_1: R24.1 U6.1(SDO/SA0)
NetR26_2: R26.2 U6.12(CS)
NetR27_1: R27.1 U6.2(SDX) U6.3(SCX)
NetR28_1: R28.1 U7.6(CS)

Not connected (* = marked no-connect by the designer): U4 1(NC)* 5(NC)* 6(NC)* 7(NC)* 8(NC)* 14(NC)*; U6 10(OCS_AUX)* 11(SDO_AUX)*

### Notes on the sheet
- Heart Rate and SPO2 Sensor
- (near R22) Temperature Sensor
- (near U4) I2C Address: 0x57
- (near U5) I2C Address: 0x48
- 6-Axis IMU
- (near C10) Pressure Sensor
- (near U7) I2C Address: 0x5C
- I2C Address: 0x6A
- File:
- Title:
- Date:
- Page
- Num:
- Total:
- Drawn By: Huzaifa Ali

### Library data of the parts
C8-C11 = CC0201KRX5R6BB104: as C6 on sheet Power-Sheet; Supplier 1: Mouser; Manufacturer Part Number: CC0201KRX5R6BB104; RoHS: Yes; Category: Ceramic Capacitors; Stock 1: 824403; Pricing 1: 1=0.10000, 10=0.02400, 50=0.02400, 100=0.01900, 1000=0.01100, 10000=0.00900 (USD); Mount: Surface Mount; Case/Package: 0201; Case Code (Imperial): 0201; Case Code (Metric): 0603; Weight: 6E-06oz; Min Operating Temperature: -55°C; Max Operating Temperature: 85°C; Capacitance: 100nF; Dielectric: X5R; Voltage Rating (DC): 10V; Packaging: Tape and Reel; Termination: SMD/SMT; Resistor Type: Ceramic; Voltage Rating: 10V; Series: CC; Construction: Flat; Length: 0.6mm; Width: 0.012inch; Height: 0.3mm; Thickness: 0.013inch; Depth: 0.3mm; Radiation Hardening: No; Lead Free: Lead Free; Halogen Free: Halogen Free; RoHS Compliant: Yes; ComponentLink1URL: https://datasheet.ciiva.com/11587/upy-gphc-x5r-4v-to-50v-12-11587190.pdf?src-supplier=Avnet; ComponentLink1Description: https://datasheet.ciiva.com/11587/upy-gphc-x5r-4v-to-50v-12-11587190.pdf?src-supplier=Avnet; Supplier Part Number 1: 603-CC201KRX5R6BB104; LCSC Part Number: C190183
C12 C13 = T58MM226M6R3C0500: CAP TANT POLY 22UF 6.3V 0603; Manufacturer: Vishay; Item Type: Capacitor; Supplier: Mouser; Supplier Part Number: 74-T58MM226M6R3C0500; Manufacturer Part Number: T58MM226M6R3C0500; RoHS: Yes; Category: Tantalum Capacitors; Stock: 4661; Pricing: 1=0.71, 10=0.379, 50=0.379, 100=0.313, 1000=0.208, 10000=0.168 (USD); ComponentLink1URL: http://www.farnell.com/datasheets/2617265.pdf?src-supplier=Farnell; ComponentLink1Description: http://www.farnell.com/datasheets/2617265.pdf?src-supplier=Farnell; ComponentLink2URL: https://datasheet.octopart.com/T58MM226M6R3C0500-Vishay-datasheet-78835337.pdf?src-supplier=Element14; ComponentLink2Description: https://datasheet.octopart.com/T58MM226M6R3C0500-Vishay-datasheet-78835337.pdf?src-supplier=Element14; ComponentLink3URL: https://datasheet.octopart.com/T58MM226M6R3C0500.-Vishay-datasheet-159617154.pdf?src-supplier=Newark; ComponentLink3Description: https://datasheet.octopart.com/T58MM226M6R3C0500.-Vishay-datasheet-159617154.pdf?src-supplier=Newark; ComponentLink4URL: http://www.farnell.com/datasheets/2617265.pdf?src-supplier=Newark; ComponentLink4Description: http://www.farnell.com/datasheets/2617265.pdf?src-supplier=Newark; ComponentLink5URL: http://www.vishay.com/docs/40189/t58.pdf?src-supplier=Avnet; ComponentLink5Description: http://www.vishay.com/docs/40189/t58.pdf?src-supplier=Avnet; ComponentLink6URL: https://datasheet.octopart.com/T58MM226M6R3C0500-Vishay-datasheet-95510002.pdf?src-supplier=Future+Electronics; ComponentLink6Description: https://datasheet.octopart.com/T58MM226M6R3C0500-Vishay-datasheet-95510002.pdf?src-supplier=Future+Electronics; ComponentLink7URL: https://www.vishay.com/docs/40189/t58.pdf?src-supplier=Digi-Key; ComponentLink7Description: https://www.vishay.com/docs/40189/t58.pdf?src-supplier=Digi-Key; Package: 0603; LCSC Part Number: C2158410; ComponentLink8Description: LCSC; ComponentLink8URL: https://www.lcsc.com/product-detail/Tantalum-Capacitors_Vishay-Intertech-T58MM226M6R3C0500_C2158410.html
R22 R23 R25 R29 R30 = RC0201FR-074K7L: as R1 on sheet Power-Sheet; Supplier: Future Electronics; Supplier Part Number: 7537285; Manufacturer Part Number: RC0201FR-074K7L; RoHS: Yes; Category: Chip SMD Resistors; Stock: 1610000; Pricing: 10000=0.0014, 50000=0.0013, 250000=0.0013, 750000=0.0012, 2000000=0.0011 (USD); ComponentLink1URL: https://datasheet.ciiva.com/2493/pyu-r-int-thick-7-2493811.pdf?src-supplier=Digi-Key; ComponentLink1Description: https://datasheet.ciiva.com/2493/pyu-r-int-thick-7-2493811.pdf?src-supplier=Digi-Key; ComponentLink2URL: https://datasheet.ciiva.com/2493/pyu-r-int-thick-7-2493812.pdf?src-supplier=Digi-Key; ComponentLink2Description: https://datasheet.ciiva.com/2493/pyu-r-int-thick-7-2493812.pdf?src-supplier=Digi-Key; ComponentLink3URL: https://datasheet.ciiva.com/2493/pyu-r-int-thick-7-2493813.pdf?src-supplier=Digi-Key; ComponentLink3Description: https://datasheet.ciiva.com/2493/pyu-r-int-thick-7-2493813.pdf?src-supplier=Digi-Key; ComponentLink4URL: https://datasheet.ciiva.com/8892/pyu-rc0201-51-rohs-l-8-8892942.pdf?src-supplier=Avnet; ComponentLink4Description: https://datasheet.ciiva.com/8892/pyu-rc0201-51-rohs-l-8-8892942.pdf?src-supplier=Avnet; ComponentLink5URL: https://datasheet.ciiva.com/7672/1563626-7672233.pdf?src-supplier=Element14; ComponentLink5Description: https://datasheet.ciiva.com/7672/1563626-7672233.pdf?src-supplier=Element14; LCSC Part Number: C138135
R24 R26-R28 = RC0201JR-070RL: as R5 on sheet Power-Sheet; Supplier 1: Digi-Key; Manufacturer Part Number: RC0201JR-070RL; RoHS: Yes; Category: Chip SMD Resistors; Stock 1: 11079; Pricing 1: 1=0.10000, 10=0.03600, 25=0.02640, 50=0.02000, 100=0.01480, 250=0.01128, 500=0.00904, 1000=0.00665, 5000=0.00477 (USD); Case/Package: 0201; Contact Plating: Tin,Matte; Case Code (Metric): 0603; Case Code (Imperial): 0201; Weight: 6E-06oz; Size Code: 0201; Min Operating Temperature: -55°C; Max Operating Temperature: 125°C; Resistor Type: Thick Film; Resistance: 0R; Packaging: Tape and Reel; Package Quantity: 10000; Number of Terminations: 2; Termination: SMD/SMT; Max Power Dissipation: 50mW; Voltage Rating (DC): 25V; Features: Moisture Resistant; Series: RC; Construction: Rectangular; Resistance Tolerance: 5%; Length: 0.6mm; Width: 0.012inch; Height: 0.01inch; Depth: 0.3mm; Radiation Hardening: No; RoHS Compliant: Yes; REACH SVHC: Unknown; Military Standard: Not; Lead Free: Lead Free; ComponentLink1URL: https://datasheet.ciiva.com/7672/1563626-7672247.pdf?src-supplier=Element14; ComponentLink1Description: https://datasheet.ciiva.com/7672/1563626-7672247.pdf?src-supplier=Element14; ComponentLink2URL: https://datasheet.ciiva.com/7660/1421516-7660808.pdf?src-supplier=Element14; ComponentLink2Description: https://datasheet.ciiva.com/7660/1421516-7660808.pdf?src-supplier=Element14; ComponentLink3URL: https://datasheet.ciiva.com/7672/1563626-7672248.pdf?src-supplier=Element14; ComponentLink3Description: https://datasheet.ciiva.com/7672/1563626-7672248.pdf?src-supplier=Element14; ComponentLink4URL: https://datasheet.ciiva.com/16855/pyu-rc0201-51-rohs-l-8-16855994.pdf?src-supplier=Avnet+Europe; ComponentLink4Description: https://datasheet.ciiva.com/16855/pyu-rc0201-51-rohs-l-8-16855994.pdf?src-supplier=Avnet+Europe; ComponentLink5URL: https://datasheet.ciiva.com/28419/pyu-rc0201-51-rohs-l-8-28419660.pdf?src-supplier=Avnet+Europe; ComponentLink5Description: https://datasheet.ciiva.com/28419/pyu-rc0201-51-rohs-l-8-28419660.pdf?src-supplier=Avnet+Europe; ComponentLink6URL: https://datasheet.ciiva.com/46391/1421516-46391340.pdf?src-supplier=Element14; ComponentLink6Description: https://datasheet.ciiva.com/46391/1421516-46391340.pdf?src-supplier=Element14; ComponentLink7URL: https://datasheet.ciiva.com/8896/pyu-rc0201-51-rohs-l-8-8896143.pdf?src-supplier=Avnet; ComponentLink7Description: https://datasheet.ciiva.com/8896/pyu-rc0201-51-rohs-l-8-8896143.pdf?src-supplier=Avnet; Supplier Part Number 1: 311-0.0NCT-ND; LCSC Part Number: C106228
U4 = MAX30102EFD+T: SENSOR OXIMETER/HEART RATE I2C; Manufacturer: Maxim; Item Type: Heart Rate Sensor; Supplier: Mouser; Supplier Part Number: 700-MAX30102EFD+T; Manufacturer Part Number: MAX30102EFD+T; RoHS: Yes; Category: Sensors; Stock: 7965; Pricing: 1=12.43, 10=9.84, 50=9.32, 100=7.95, 1000=7.05, 10000=6.66 (USD); Min Operating Temperature: -40°C; Max Operating Temperature: 85°C; Output Type: I2C; Series: -; Packaging: Cut Tape; RoHS Compliant: Yes; ComponentLink1URL: https://datasheets.maximintegrated.com/en/ds/MAX30102.pdf?src-supplier=Digi-Key; ComponentLink1Description: https://datasheets.maximintegrated.com/en/ds/MAX30102.pdf?src-supplier=Digi-Key; LCSC Part Number: C6454833
U5 = TMP117AIDRVR: Temperature Sensor Digital, Local -55°C ~ 150°C 16 b 6-WSON (2x2); Manufacturer: Texas Instruments; Item Type: IC; Interface: 39,4268,4478Interface; Max Supply Voltage: 5.5V; Min Supply Voltage: 1.8V; Supplier: Mouser; LCSC Part Number: C699536; Manufacturer Part Number: TMP117AIDRVR; RoHS: Yes; Stock: 14370; Pricing: 1=4.53, 10=3.95, 50=3.64, 100=3.52, 1000=3.27, 10000=3.04 (USD); Pins: 6NUMBER; Length: 2mm; Width: 2mm; Height: 800um; Thickness: 750um; ComponentLink1URL: http://www.ti.com/lit/gpn/tmp117?src-supplier=Digikey; ComponentLink1Description: http://www.ti.com/lit/gpn/tmp117?src-supplier=Digikey; ComponentLink2URL: http://www.ti.com/lit/ds/symlink/tmp117.pdf?src-supplier=Digikey; ComponentLink2Description: http://www.ti.com/lit/ds/symlink/tmp117.pdf?src-supplier=Digikey
U6 = LSM6DSOXTR: INEMO INERTIAL MODULE: 3D ACCELE; Manufacturer: STMicroelectronics; Item Type: IC; Sensor Type: Accelerometer,Gyroscope,6 Axis; Output Type: SPI,I2C; Max Supply Voltage: 3.6V; Min Supply Voltage: 1.62V; Operating Supply Current: 550uA; Operating Supply Voltage: 1.8V; Supplier: Mouser; LCSC Part Number: C481766; Manufacturer Part Number: LSM6DSOXTR; RoHS: Yes; Stock: 1151; Pricing: 1=4.21, 10=3.61, 50=3.28, 100=3.16, 1000=2.84, 10000=2.64 (USD); Mounting Technology: Surface Mount; Case/Package: LGA; Min Operating Temperature: -40°C; Max Operating Temperature: 85°C; Series: iNEMO; Packaging: Cut Tape; Height: 860um; ComponentLink1URL: http://www.farnell.com/datasheets/2736724.pdf?src-supplier=Farnell; ComponentLink1Description: http://www.farnell.com/datasheets/2736724.pdf?src-supplier=Farnell; ComponentLink2URL: https://www.st.com/resource/en/datasheet/lsm6dsox.pdf?src-supplier=Digikey; ComponentLink2Description: https://www.st.com/resource/en/datasheet/lsm6dsox.pdf?src-supplier=Digikey; ComponentLink3URL: http://www.farnell.com/datasheets/2736724.pdf?src-supplier=Element14; ComponentLink3Description: http://www.farnell.com/datasheets/2736724.pdf?src-supplier=Element14; ComponentLink4URL: http://www.farnell.com/datasheets/2736724.pdf?src-supplier=Newark; ComponentLink4Description: http://www.farnell.com/datasheets/2736724.pdf?src-supplier=Newark
U7 = LPS22HHTR: SENSOR 18.27PSIA 24BIT 10HLGA; Manufacturer: STMicroelectronics; Item Type: Pressure Sensors; Output Type: SPI,I2C; Pressure Type: Absolute; Port Style: No Port; Max Pressure: 290PSI; Max Supply Voltage: 3.7V; Min Supply Voltage: 1.7V; Supplier: Mouser; LCSC Part Number: C2827824; Manufacturer Part Number: LPS22HHTR; RoHS: Yes; Stock: 8715; Pricing: 1=2.49, 10=2, 50=1.91, 100=1.84, 1000=1.63, 10000=1.49 (USD); Case/Package: HLGA; Pins: 10; Min Operating Temperature: -40°C; Max Operating Temperature: 85°C; Termination: SMD/SMT; Series: -; Packaging: Cut Tape; Operating Pressure: 18.27PSI; Height: 800um; RoHS Compliant: Yes; ComponentLink1URL: http://www.farnell.com/datasheets/2710908.pdf?src-supplier=Farnell; ComponentLink1Description: http://www.farnell.com/datasheets/2710908.pdf?src-supplier=Farnell; ComponentLink2URL: http://www.farnell.com/datasheets/2710908.pdf?src-supplier=Newark; ComponentLink2Description: http://www.farnell.com/datasheets/2710908.pdf?src-supplier=Newark; ComponentLink3URL: https://www.st.com/resource/en/datasheet/lps22hh.pdf?src-supplier=Digikey; ComponentLink3Description: https://www.st.com/resource/en/datasheet/lps22hh.pdf?src-supplier=Digikey; ComponentLink4URL: https://www.st.com/resource/en/data_brief/lps22hh.pdf?src-supplier=Digikey; ComponentLink4Description: https://www.st.com/resource/en/data_brief/lps22hh.pdf?src-supplier=Digikey

## Nets that join several sheets
1V8: Power-Sheet (9 pins), Controller-Sheet (7 pins), Sensors-Sheet (17 pins)
GND: Power-Sheet (17 pins), Controller-Sheet (24 pins), Sensors-Sheet (19 pins)
VBAT: Power-Sheet (5 pins), Controller-Sheet (R12.2)
VLED+: Power-Sheet (C1.2 U1.A3 U1.B3), Sensors-Sheet (C12.1 C13.1 U4.9 U4.10)
ALRT_TMP: Controller-Sheet (U3.35), Sensors-Sheet (R22.1 U5.3)
CD: Power-Sheet (R1.2 U1.E2), Controller-Sheet (U3.25)
INT: Power-Sheet (R2.2 U1.D2), Controller-Sheet (U3.26)
INT1_LSM: Controller-Sheet (U3.31), Sensors-Sheet (R29.1 U6.4)
INT2_LSM: Controller-Sheet (U3.34), Sensors-Sheet (R30.1 U6.9)
INT_LPS: Controller-Sheet (U3.30), Sensors-Sheet (R25.1 U7.7)
MAX_INT: Controller-Sheet (U3.29), Sensors-Sheet (R23.1 U4.13)
RST: Power-Sheet (R3.2 U1.D3), Controller-Sheet (U3.27)
SCL: Power-Sheet (U1.E5), Controller-Sheet (R21.1 U3.15), Sensors-Sheet (U4.2 U5.1 U6.13 U7.2)
SDA: Power-Sheet (U1.E4), Controller-Sheet (R20.1 U3.14), Sensors-Sheet (U4.3 U5.6 U6.14 U7.4)